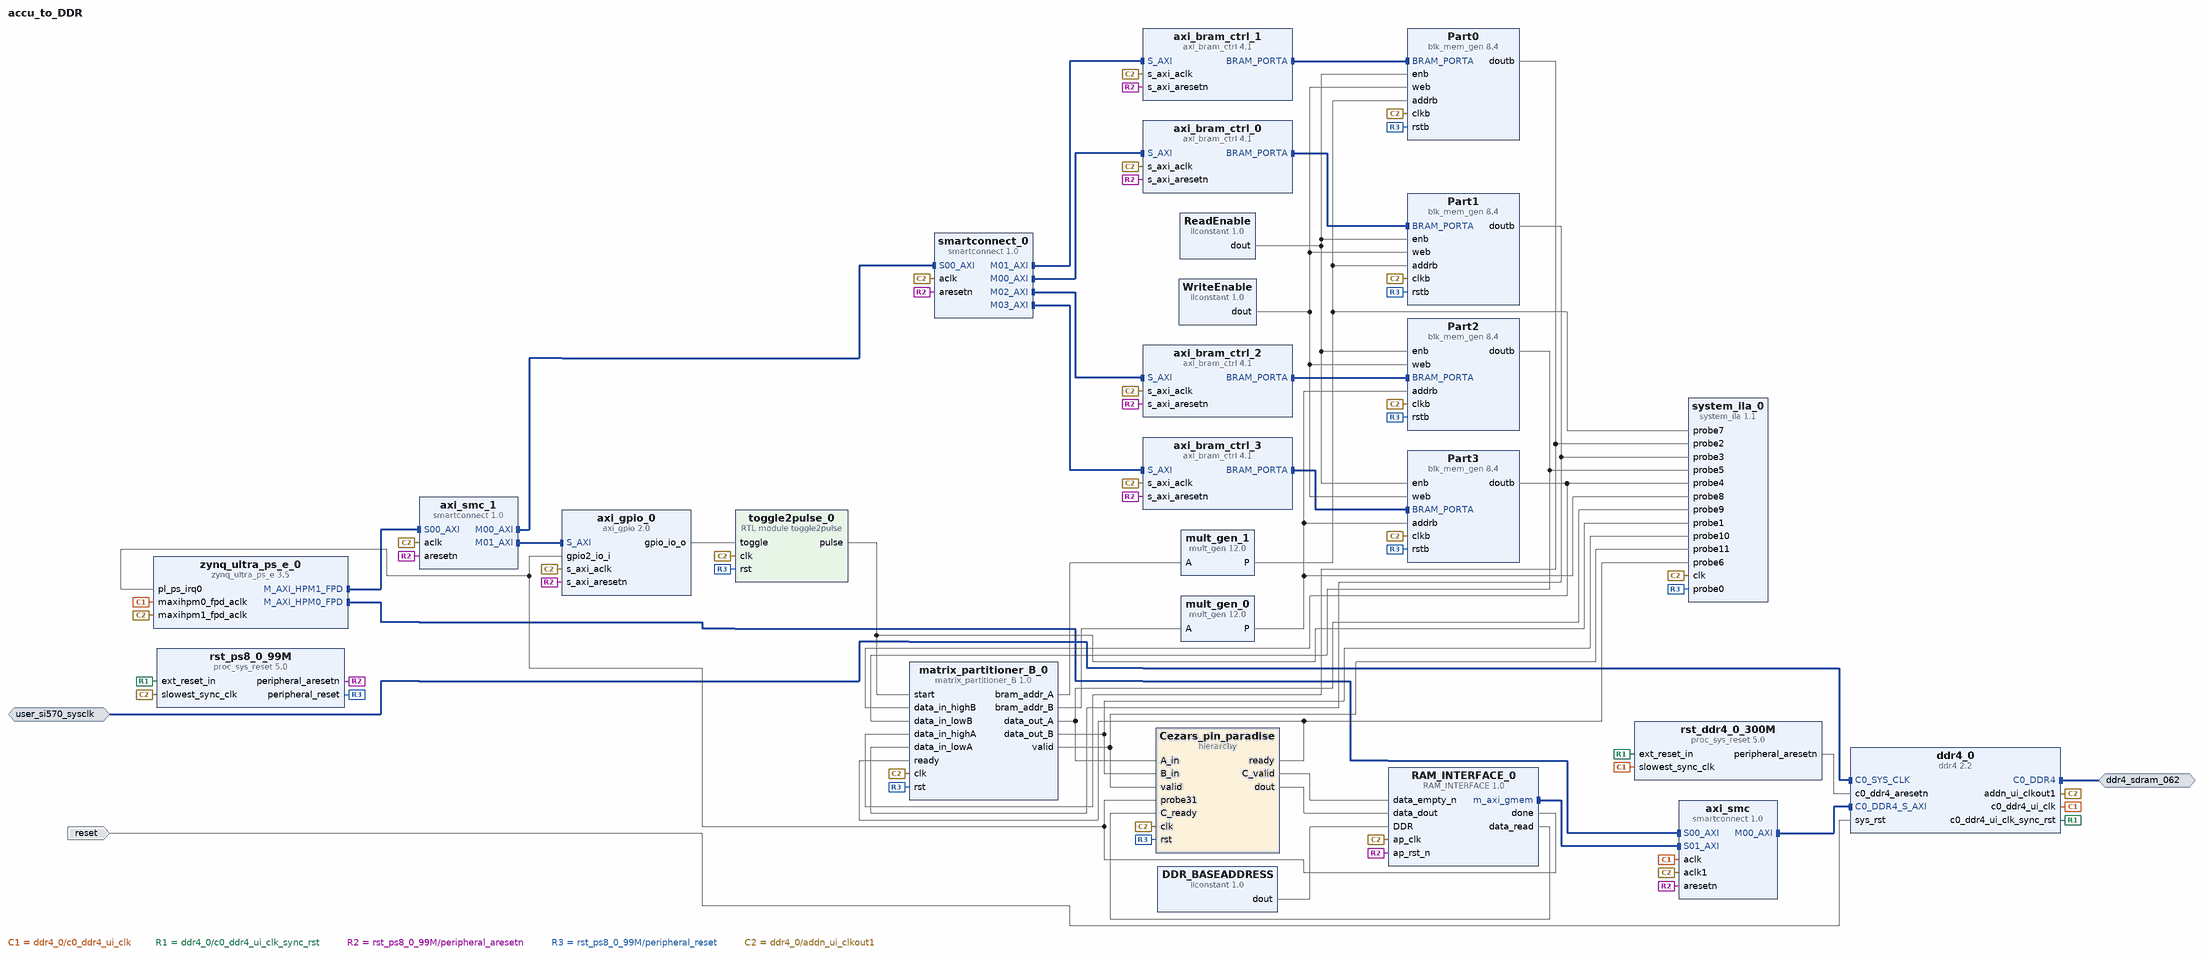
[diagram p0: block diagram of the top level]
# Vivado block design accu_to_DDR, xczu9eg-ffvb1156-2-e, Vivado 2025.1.1
create_bd_design accu_to_DDR

create_bd_intf_port -mode Master -vlnv xilinx.com:interface:ddr4_rtl:1.0 ddr4_sdram_062
create_bd_intf_port -mode Slave -vlnv xilinx.com:interface:diff_clock_rtl:1.0 user_si570_sysclk
set_property -dict {CONFIG.FREQ_HZ 300000000} [get_bd_intf_ports user_si570_sysclk]
create_bd_port -dir I -type rst reset
set_property -dict {CONFIG.POLARITY ACTIVE_HIGH} [get_bd_ports reset]

create_bd_cell -type hier Cezars_pin_paradise
create_bd_cell -type ip -vlnv xilinx.com:ip:zynq_ultra_ps_e:3.5 zynq_ultra_ps_e_0
set_property -dict [list \
  CONFIG.PSU_BANK_0_IO_STANDARD LVCMOS18 \
  CONFIG.PSU_BANK_1_IO_STANDARD LVCMOS18 \
  CONFIG.PSU_BANK_2_IO_STANDARD LVCMOS18 \
  CONFIG.PSU_BANK_3_IO_STANDARD LVCMOS18 \
  CONFIG.PSU_DYNAMIC_DDR_CONFIG_EN 1 \
  CONFIG.PSU_USB3__DUAL_CLOCK_ENABLE 1 \
  CONFIG.PSU__CAN1__PERIPHERAL__ENABLE 1 \
  CONFIG.PSU__CAN1__PERIPHERAL__IO {MIO 24 .. 25} \
  CONFIG.PSU__CRF_APB__ACPU_CTRL__FREQMHZ 1200 \
  CONFIG.PSU__CRF_APB__ACPU_CTRL__SRCSEL APLL \
  CONFIG.PSU__CRF_APB__APLL_CTRL__SRCSEL PSS_REF_CLK \
  CONFIG.PSU__CRF_APB__DBG_FPD_CTRL__FREQMHZ 250 \
  CONFIG.PSU__CRF_APB__DBG_FPD_CTRL__SRCSEL IOPLL \
  CONFIG.PSU__CRF_APB__DBG_TRACE_CTRL__FREQMHZ 250 \
  CONFIG.PSU__CRF_APB__DBG_TRACE_CTRL__SRCSEL IOPLL \
  CONFIG.PSU__CRF_APB__DBG_TSTMP_CTRL__FREQMHZ 250 \
  CONFIG.PSU__CRF_APB__DBG_TSTMP_CTRL__SRCSEL IOPLL \
  CONFIG.PSU__CRF_APB__DDR_CTRL__FREQMHZ 1067 \
  CONFIG.PSU__CRF_APB__DDR_CTRL__SRCSEL DPLL \
  CONFIG.PSU__CRF_APB__DPDMA_REF_CTRL__FREQMHZ 600 \
  CONFIG.PSU__CRF_APB__DPDMA_REF_CTRL__SRCSEL APLL \
  CONFIG.PSU__CRF_APB__DPLL_CTRL__SRCSEL PSS_REF_CLK \
  CONFIG.PSU__CRF_APB__DP_AUDIO_REF_CTRL__SRCSEL RPLL \
  CONFIG.PSU__CRF_APB__DP_STC_REF_CTRL__SRCSEL RPLL \
  CONFIG.PSU__CRF_APB__DP_VIDEO_REF_CTRL__SRCSEL VPLL \
  CONFIG.PSU__CRF_APB__GDMA_REF_CTRL__FREQMHZ 600 \
  CONFIG.PSU__CRF_APB__GDMA_REF_CTRL__SRCSEL APLL \
  CONFIG.PSU__CRF_APB__GPU_REF_CTRL__FREQMHZ 500 \
  CONFIG.PSU__CRF_APB__GPU_REF_CTRL__SRCSEL IOPLL \
  CONFIG.PSU__CRF_APB__TOPSW_LSBUS_CTRL__FREQMHZ 100 \
  CONFIG.PSU__CRF_APB__TOPSW_LSBUS_CTRL__SRCSEL IOPLL \
  CONFIG.PSU__CRF_APB__TOPSW_MAIN_CTRL__FREQMHZ 533.33 \
  CONFIG.PSU__CRF_APB__TOPSW_MAIN_CTRL__SRCSEL DPLL \
  CONFIG.PSU__CRF_APB__VPLL_CTRL__SRCSEL PSS_REF_CLK \
  CONFIG.PSU__CRL_APB__ADMA_REF_CTRL__FREQMHZ 500 \
  CONFIG.PSU__CRL_APB__ADMA_REF_CTRL__SRCSEL IOPLL \
  CONFIG.PSU__CRL_APB__CAN1_REF_CTRL__FREQMHZ 100 \
  CONFIG.PSU__CRL_APB__CAN1_REF_CTRL__SRCSEL IOPLL \
  CONFIG.PSU__CRL_APB__CPU_R5_CTRL__FREQMHZ 500 \
  CONFIG.PSU__CRL_APB__CPU_R5_CTRL__SRCSEL IOPLL \
  CONFIG.PSU__CRL_APB__DBG_LPD_CTRL__FREQMHZ 250 \
  CONFIG.PSU__CRL_APB__DBG_LPD_CTRL__SRCSEL IOPLL \
  CONFIG.PSU__CRL_APB__GEM3_REF_CTRL__FREQMHZ 125 \
  CONFIG.PSU__CRL_APB__GEM3_REF_CTRL__SRCSEL IOPLL \
  CONFIG.PSU__CRL_APB__I2C0_REF_CTRL__FREQMHZ 100 \
  CONFIG.PSU__CRL_APB__I2C0_REF_CTRL__SRCSEL IOPLL \
  CONFIG.PSU__CRL_APB__I2C1_REF_CTRL__FREQMHZ 100 \
  CONFIG.PSU__CRL_APB__I2C1_REF_CTRL__SRCSEL IOPLL \
  CONFIG.PSU__CRL_APB__IOPLL_CTRL__SRCSEL PSS_REF_CLK \
  CONFIG.PSU__CRL_APB__IOU_SWITCH_CTRL__FREQMHZ 250 \
  CONFIG.PSU__CRL_APB__IOU_SWITCH_CTRL__SRCSEL IOPLL \
  CONFIG.PSU__CRL_APB__LPD_LSBUS_CTRL__FREQMHZ 100 \
  CONFIG.PSU__CRL_APB__LPD_LSBUS_CTRL__SRCSEL IOPLL \
  CONFIG.PSU__CRL_APB__LPD_SWITCH_CTRL__FREQMHZ 500 \
  CONFIG.PSU__CRL_APB__LPD_SWITCH_CTRL__SRCSEL IOPLL \
  CONFIG.PSU__CRL_APB__PCAP_CTRL__FREQMHZ 200 \
  CONFIG.PSU__CRL_APB__PCAP_CTRL__SRCSEL IOPLL \
  CONFIG.PSU__CRL_APB__QSPI_REF_CTRL__FREQMHZ 125 \
  CONFIG.PSU__CRL_APB__QSPI_REF_CTRL__SRCSEL IOPLL \
  CONFIG.PSU__CRL_APB__RPLL_CTRL__SRCSEL PSS_REF_CLK \
  CONFIG.PSU__CRL_APB__SDIO1_REF_CTRL__FREQMHZ 200 \
  CONFIG.PSU__CRL_APB__SDIO1_REF_CTRL__SRCSEL IOPLL \
  CONFIG.PSU__CRL_APB__TIMESTAMP_REF_CTRL__FREQMHZ 100 \
  CONFIG.PSU__CRL_APB__TIMESTAMP_REF_CTRL__SRCSEL IOPLL \
  CONFIG.PSU__CRL_APB__UART0_REF_CTRL__FREQMHZ 100 \
  CONFIG.PSU__CRL_APB__UART0_REF_CTRL__SRCSEL IOPLL \
  CONFIG.PSU__CRL_APB__UART1_REF_CTRL__FREQMHZ 100 \
  CONFIG.PSU__CRL_APB__UART1_REF_CTRL__SRCSEL IOPLL \
  CONFIG.PSU__CRL_APB__USB0_BUS_REF_CTRL__FREQMHZ 250 \
  CONFIG.PSU__CRL_APB__USB0_BUS_REF_CTRL__SRCSEL IOPLL \
  CONFIG.PSU__CRL_APB__USB3_DUAL_REF_CTRL__FREQMHZ 20 \
  CONFIG.PSU__CRL_APB__USB3_DUAL_REF_CTRL__SRCSEL IOPLL \
  CONFIG.PSU__CRL_APB__USB3__ENABLE 1 \
  CONFIG.PSU__CSUPMU__PERIPHERAL__VALID 1 \
  CONFIG.PSU__DDRC__BUS_WIDTH {64 Bit} \
  CONFIG.PSU__DDRC__COMPONENTS UDIMM \
  CONFIG.PSU__DDRC__DEVICE_CAPACITY {4096 MBits} \
  CONFIG.PSU__DDRC__DRAM_WIDTH {8 Bits} \
  CONFIG.PSU__DDRC__ECC Disabled \
  CONFIG.PSU__DDRC__MEMORY_TYPE {DDR 4} \
  CONFIG.PSU__DDRC__SPEED_BIN DDR4_2133P \
  CONFIG.PSU__DDR_HIGH_ADDRESS_GUI_ENABLE 1 \
  CONFIG.PSU__DDR__INTERFACE__FREQMHZ 533.500 \
  CONFIG.PSU__DISPLAYPORT__LANE0__ENABLE 1 \
  CONFIG.PSU__DISPLAYPORT__LANE0__IO {GT Lane1} \
  CONFIG.PSU__DISPLAYPORT__LANE1__ENABLE 0 \
  CONFIG.PSU__DISPLAYPORT__PERIPHERAL__ENABLE 1 \
  CONFIG.PSU__DLL__ISUSED 1 \
  CONFIG.PSU__DPAUX__PERIPHERAL__ENABLE 1 \
  CONFIG.PSU__DPAUX__PERIPHERAL__IO {MIO 27 .. 30} \
  CONFIG.PSU__DP__LANE_SEL {Single Lower} \
  CONFIG.PSU__DP__REF_CLK_FREQ 27 \
  CONFIG.PSU__DP__REF_CLK_SEL {Ref Clk3} \
  CONFIG.PSU__ENET3__FIFO__ENABLE 0 \
  CONFIG.PSU__ENET3__GRP_MDIO__ENABLE 1 \
  CONFIG.PSU__ENET3__GRP_MDIO__IO {MIO 76 .. 77} \
  CONFIG.PSU__ENET3__PERIPHERAL__ENABLE 1 \
  CONFIG.PSU__ENET3__PERIPHERAL__IO {MIO 64 .. 75} \
  CONFIG.PSU__ENET3__PTP__ENABLE 0 \
  CONFIG.PSU__ENET3__TSU__ENABLE 0 \
  CONFIG.PSU__FPGA_PL0_ENABLE 0 \
  CONFIG.PSU__GEM3_COHERENCY 0 \
  CONFIG.PSU__GEM3_ROUTE_THROUGH_FPD 0 \
  CONFIG.PSU__GEM__TSU__ENABLE 0 \
  CONFIG.PSU__GPIO0_MIO__IO {MIO 0 .. 25} \
  CONFIG.PSU__GPIO0_MIO__PERIPHERAL__ENABLE 1 \
  CONFIG.PSU__GPIO1_MIO__IO {MIO 26 .. 51} \
  CONFIG.PSU__GPIO1_MIO__PERIPHERAL__ENABLE 1 \
  CONFIG.PSU__GPIO_EMIO__WIDTH {[95:0]} \
  CONFIG.PSU__GT__LINK_SPEED HBR \
  CONFIG.PSU__GT__PRE_EMPH_LVL_4 0 \
  CONFIG.PSU__GT__VLT_SWNG_LVL_4 0 \
  CONFIG.PSU__I2C0__PERIPHERAL__ENABLE 1 \
  CONFIG.PSU__I2C0__PERIPHERAL__IO {MIO 14 .. 15} \
  CONFIG.PSU__I2C1__PERIPHERAL__ENABLE 1 \
  CONFIG.PSU__I2C1__PERIPHERAL__IO {MIO 16 .. 17} \
  CONFIG.PSU__IOU_SLCR__IOU_TTC_APB_CLK__TTC0_SEL APB \
  CONFIG.PSU__IOU_SLCR__IOU_TTC_APB_CLK__TTC1_SEL APB \
  CONFIG.PSU__IOU_SLCR__IOU_TTC_APB_CLK__TTC2_SEL APB \
  CONFIG.PSU__IOU_SLCR__IOU_TTC_APB_CLK__TTC3_SEL APB \
  CONFIG.PSU__MAXIGP0__DATA_WIDTH 128 \
  CONFIG.PSU__OVERRIDE__BASIC_CLOCK 0 \
  CONFIG.PSU__PCIE__BAR0_VAL 0x0 \
  CONFIG.PSU__PCIE__BAR1_VAL 0x0 \
  CONFIG.PSU__PCIE__BAR2_VAL 0x0 \
  CONFIG.PSU__PCIE__BAR3_VAL 0x0 \
  CONFIG.PSU__PCIE__BAR4_VAL 0x0 \
  CONFIG.PSU__PCIE__BAR5_VAL 0x0 \
  CONFIG.PSU__PCIE__CLASS_CODE_BASE 0x06 \
  CONFIG.PSU__PCIE__CLASS_CODE_INTERFACE 0x0 \
  CONFIG.PSU__PCIE__CLASS_CODE_SUB 0x4 \
  CONFIG.PSU__PCIE__CLASS_CODE_VALUE 0x60400 \
  CONFIG.PSU__PCIE__CRS_SW_VISIBILITY 1 \
  CONFIG.PSU__PCIE__DEVICE_ID 0xD021 \
  CONFIG.PSU__PCIE__DEVICE_PORT_TYPE {Root Port} \
  CONFIG.PSU__PCIE__EROM_VAL 0x0 \
  CONFIG.PSU__PCIE__LANE0__ENABLE 1 \
  CONFIG.PSU__PCIE__LANE0__IO {GT Lane0} \
  CONFIG.PSU__PCIE__LINK_SPEED {5.0 Gb/s} \
  CONFIG.PSU__PCIE__MAXIMUM_LINK_WIDTH x1 \
  CONFIG.PSU__PCIE__MAX_PAYLOAD_SIZE {256 bytes} \
  CONFIG.PSU__PCIE__PERIPHERAL__ENABLE 1 \
  CONFIG.PSU__PCIE__PERIPHERAL__ENDPOINT_ENABLE 0 \
  CONFIG.PSU__PCIE__PERIPHERAL__ROOTPORT_ENABLE 1 \
  CONFIG.PSU__PCIE__PERIPHERAL__ROOTPORT_IO {MIO 31} \
  CONFIG.PSU__PCIE__REF_CLK_FREQ 100 \
  CONFIG.PSU__PCIE__REF_CLK_SEL {Ref Clk0} \
  CONFIG.PSU__PCIE__REVISION_ID 0x0 \
  CONFIG.PSU__PCIE__SUBSYSTEM_ID 0x7 \
  CONFIG.PSU__PCIE__SUBSYSTEM_VENDOR_ID 0x10EE \
  CONFIG.PSU__PCIE__VENDOR_ID 0x10EE \
  CONFIG.PSU__PMU_COHERENCY 0 \
  CONFIG.PSU__PMU__AIBACK__ENABLE 0 \
  CONFIG.PSU__PMU__EMIO_GPI__ENABLE 0 \
  CONFIG.PSU__PMU__EMIO_GPO__ENABLE 0 \
  CONFIG.PSU__PMU__GPI0__ENABLE 0 \
  CONFIG.PSU__PMU__GPI1__ENABLE 0 \
  CONFIG.PSU__PMU__GPI2__ENABLE 0 \
  CONFIG.PSU__PMU__GPI3__ENABLE 0 \
  CONFIG.PSU__PMU__GPI4__ENABLE 0 \
  CONFIG.PSU__PMU__GPI5__ENABLE 0 \
  CONFIG.PSU__PMU__GPO0__ENABLE 1 \
  CONFIG.PSU__PMU__GPO0__IO {MIO 32} \
  CONFIG.PSU__PMU__GPO1__ENABLE 1 \
  CONFIG.PSU__PMU__GPO1__IO {MIO 33} \
  CONFIG.PSU__PMU__GPO2__ENABLE 1 \
  CONFIG.PSU__PMU__GPO2__IO {MIO 34} \
  CONFIG.PSU__PMU__GPO2__POLARITY high \
  CONFIG.PSU__PMU__GPO3__ENABLE 1 \
  CONFIG.PSU__PMU__GPO3__IO {MIO 35} \
  CONFIG.PSU__PMU__GPO3__POLARITY low \
  CONFIG.PSU__PMU__GPO4__ENABLE 1 \
  CONFIG.PSU__PMU__GPO4__IO {MIO 36} \
  CONFIG.PSU__PMU__GPO4__POLARITY low \
  CONFIG.PSU__PMU__GPO5__ENABLE 1 \
  CONFIG.PSU__PMU__GPO5__IO {MIO 37} \
  CONFIG.PSU__PMU__GPO5__POLARITY low \
  CONFIG.PSU__PMU__PERIPHERAL__ENABLE 1 \
  CONFIG.PSU__PMU__PLERROR__ENABLE 0 \
  CONFIG.PSU__PRESET_APPLIED 1 \
  CONFIG.PSU__PSS_REF_CLK__FREQMHZ 33.330 \
  CONFIG.PSU__QSPI_COHERENCY 0 \
  CONFIG.PSU__QSPI_ROUTE_THROUGH_FPD 0 \
  CONFIG.PSU__QSPI__GRP_FBCLK__ENABLE 1 \
  CONFIG.PSU__QSPI__GRP_FBCLK__IO {MIO 6} \
  CONFIG.PSU__QSPI__PERIPHERAL__DATA_MODE x4 \
  CONFIG.PSU__QSPI__PERIPHERAL__ENABLE 1 \
  CONFIG.PSU__QSPI__PERIPHERAL__IO {MIO 0 .. 12} \
  CONFIG.PSU__QSPI__PERIPHERAL__MODE {Dual Parallel} \
  CONFIG.PSU__SATA__LANE1__IO {GT Lane3} \
  CONFIG.PSU__SATA__PERIPHERAL__ENABLE 1 \
  CONFIG.PSU__SATA__REF_CLK_FREQ 125 \
  CONFIG.PSU__SATA__REF_CLK_SEL {Ref Clk1} \
  CONFIG.PSU__SD1_COHERENCY 0 \
  CONFIG.PSU__SD1_ROUTE_THROUGH_FPD 0 \
  CONFIG.PSU__SD1__CLK_100_SDR_OTAP_DLY 0x3 \
  CONFIG.PSU__SD1__CLK_200_SDR_OTAP_DLY 0x3 \
  CONFIG.PSU__SD1__CLK_50_DDR_ITAP_DLY 0x3D \
  CONFIG.PSU__SD1__CLK_50_DDR_OTAP_DLY 0x4 \
  CONFIG.PSU__SD1__CLK_50_SDR_ITAP_DLY 0x15 \
  CONFIG.PSU__SD1__CLK_50_SDR_OTAP_DLY 0x5 \
  CONFIG.PSU__SD1__DATA_TRANSFER_MODE 8Bit \
  CONFIG.PSU__SD1__GRP_CD__ENABLE 1 \
  CONFIG.PSU__SD1__GRP_CD__IO {MIO 45} \
  CONFIG.PSU__SD1__GRP_POW__ENABLE 0 \
  CONFIG.PSU__SD1__GRP_WP__ENABLE 1 \
  CONFIG.PSU__SD1__GRP_WP__IO {MIO 44} \
  CONFIG.PSU__SD1__PERIPHERAL__ENABLE 1 \
  CONFIG.PSU__SD1__PERIPHERAL__IO {MIO 39 .. 51} \
  CONFIG.PSU__SD1__SLOT_TYPE {SD 3.0} \
  CONFIG.PSU__SWDT0__CLOCK__ENABLE 0 \
  CONFIG.PSU__SWDT0__PERIPHERAL__ENABLE 1 \
  CONFIG.PSU__SWDT0__RESET__ENABLE 0 \
  CONFIG.PSU__SWDT1__CLOCK__ENABLE 0 \
  CONFIG.PSU__SWDT1__PERIPHERAL__ENABLE 1 \
  CONFIG.PSU__SWDT1__RESET__ENABLE 0 \
  CONFIG.PSU__TSU__BUFG_PORT_PAIR 0 \
  CONFIG.PSU__TTC0__CLOCK__ENABLE 0 \
  CONFIG.PSU__TTC0__PERIPHERAL__ENABLE 1 \
  CONFIG.PSU__TTC0__WAVEOUT__ENABLE 0 \
  CONFIG.PSU__TTC1__CLOCK__ENABLE 0 \
  CONFIG.PSU__TTC1__PERIPHERAL__ENABLE 1 \
  CONFIG.PSU__TTC1__WAVEOUT__ENABLE 0 \
  CONFIG.PSU__TTC2__CLOCK__ENABLE 0 \
  CONFIG.PSU__TTC2__PERIPHERAL__ENABLE 1 \
  CONFIG.PSU__TTC2__WAVEOUT__ENABLE 0 \
  CONFIG.PSU__TTC3__CLOCK__ENABLE 0 \
  CONFIG.PSU__TTC3__PERIPHERAL__ENABLE 1 \
  CONFIG.PSU__TTC3__WAVEOUT__ENABLE 0 \
  CONFIG.PSU__UART0__BAUD_RATE 115200 \
  CONFIG.PSU__UART0__MODEM__ENABLE 0 \
  CONFIG.PSU__UART0__PERIPHERAL__ENABLE 1 \
  CONFIG.PSU__UART0__PERIPHERAL__IO {MIO 18 .. 19} \
  CONFIG.PSU__UART1__BAUD_RATE 115200 \
  CONFIG.PSU__UART1__MODEM__ENABLE 0 \
  CONFIG.PSU__UART1__PERIPHERAL__ENABLE 1 \
  CONFIG.PSU__UART1__PERIPHERAL__IO {MIO 20 .. 21} \
  CONFIG.PSU__USB0_COHERENCY 0 \
  CONFIG.PSU__USB0__PERIPHERAL__ENABLE 1 \
  CONFIG.PSU__USB0__PERIPHERAL__IO {MIO 52 .. 63} \
  CONFIG.PSU__USB0__REF_CLK_FREQ 26 \
  CONFIG.PSU__USB0__REF_CLK_SEL {Ref Clk2} \
  CONFIG.PSU__USB2_0__EMIO__ENABLE 0 \
  CONFIG.PSU__USB3_0__EMIO__ENABLE 0 \
  CONFIG.PSU__USB3_0__PERIPHERAL__ENABLE 1 \
  CONFIG.PSU__USB3_0__PERIPHERAL__IO {GT Lane2} \
  CONFIG.PSU__USB__RESET__MODE {Boot Pin} \
  CONFIG.PSU__USB__RESET__POLARITY {Active Low} \
  CONFIG.PSU__USE__FABRIC__RST 0 \
  CONFIG.PSU__USE__IRQ0 1 \
  CONFIG.PSU__USE__M_AXI_GP0 1 \
  CONFIG.PSU__USE__M_AXI_GP1 1 \
  CONFIG.PSU__USE__M_AXI_GP2 0 \
] [get_bd_cells zynq_ultra_ps_e_0]
# 105 more settings of zynq_ultra_ps_e_0 are not shown: defaults, MIO pin electricals, DDR timing, and values the tool derives
create_bd_cell -type ip -vlnv xilinx.com:ip:proc_sys_reset:5.0 rst_ps8_0_99M
set_property -dict {CONFIG.RESET_BOARD_INTERFACE Custom CONFIG.USE_BOARD_FLOW true} [get_bd_cells rst_ps8_0_99M]
create_bd_cell -type inline_hdl -vlnv xilinx.com:inline_hdl:ilconstant:1.0 DDR_BASEADDRESS
set_property -dict {CONFIG.CONST_VAL 0x400000000 CONFIG.CONST_WIDTH 64} [get_bd_cells DDR_BASEADDRESS]
create_bd_cell -type ip -vlnv xilinx.com:ip:ddr4:2.2 ddr4_0
set_property -dict [list \
  CONFIG.ADDN_UI_CLKOUT1_FREQ_HZ 100 \
  CONFIG.C0_CLOCK_BOARD_INTERFACE user_si570_sysclk \
  CONFIG.C0_DDR4_BOARD_INTERFACE ddr4_sdram_062 \
  CONFIG.RESET_BOARD_INTERFACE reset \
] [get_bd_cells ddr4_0]
create_bd_cell -type ip -vlnv xilinx.com:ip:smartconnect:1.0 axi_smc
set_property -dict {CONFIG.NUM_CLKS 2 CONFIG.NUM_SI 2} [get_bd_cells axi_smc]
create_bd_cell -type ip -vlnv xilinx.com:ip:proc_sys_reset:5.0 rst_ddr4_0_300M
create_bd_cell -type inline_hdl -vlnv xilinx.com:inline_hdl:ilconstant:1.0 ReadEnable
create_bd_cell -type inline_hdl -vlnv xilinx.com:inline_hdl:ilconstant:1.0 WriteEnable
set_property -dict {CONFIG.CONST_VAL 0 CONFIG.CONST_WIDTH 4} [get_bd_cells WriteEnable]
create_bd_cell -type ip -vlnv xilinx.com:ip:smartconnect:1.0 axi_smc_1
set_property -dict {CONFIG.NUM_MI 2 CONFIG.NUM_SI 1} [get_bd_cells axi_smc_1]
create_bd_cell -type module -reference toggle2pulse toggle2pulse_0
set_property -dict {CONFIG.pulse_width 105} [get_bd_cells toggle2pulse_0]
create_bd_cell -type ip -vlnv xilinx.com:ip:system_ila:1.1 system_ila_0
set_property -dict {CONFIG.C_MON_TYPE NATIVE CONFIG.C_NUM_OF_PROBES 12} [get_bd_cells system_ila_0]
create_bd_cell -type ip -vlnv xilinx.com:ip:smartconnect:1.0 smartconnect_0
set_property -dict {CONFIG.NUM_MI 4 CONFIG.NUM_SI 1} [get_bd_cells smartconnect_0]
create_bd_cell -type ip -vlnv xilinx.com:ip:axi_bram_ctrl:4.1 axi_bram_ctrl_0
set_property -dict {CONFIG.DATA_WIDTH 32 CONFIG.SINGLE_PORT_BRAM 1} [get_bd_cells axi_bram_ctrl_0]
create_bd_cell -type ip -vlnv xilinx.com:ip:axi_bram_ctrl:4.1 axi_bram_ctrl_1
set_property -dict {CONFIG.DATA_WIDTH 32 CONFIG.SINGLE_PORT_BRAM 1} [get_bd_cells axi_bram_ctrl_1]
create_bd_cell -type ip -vlnv xilinx.com:ip:blk_mem_gen:8.4 Part1
set_property -dict {CONFIG.Memory_Type True_Dual_Port_RAM} [get_bd_cells Part1]
create_bd_cell -type ip -vlnv xilinx.com:ip:blk_mem_gen:8.4 Part0
set_property -dict {CONFIG.Memory_Type True_Dual_Port_RAM} [get_bd_cells Part0]
create_bd_cell -type ip -vlnv xilinx.com:ip:axi_bram_ctrl:4.1 axi_bram_ctrl_2
set_property -dict {CONFIG.DATA_WIDTH 32 CONFIG.SINGLE_PORT_BRAM 1} [get_bd_cells axi_bram_ctrl_2]
create_bd_cell -type ip -vlnv xilinx.com:ip:axi_bram_ctrl:4.1 axi_bram_ctrl_3
set_property -dict {CONFIG.DATA_WIDTH 32 CONFIG.SINGLE_PORT_BRAM 1} [get_bd_cells axi_bram_ctrl_3]
create_bd_cell -type ip -vlnv xilinx.com:ip:blk_mem_gen:8.4 Part2
set_property -dict {CONFIG.Memory_Type True_Dual_Port_RAM} [get_bd_cells Part2]
create_bd_cell -type ip -vlnv xilinx.com:ip:blk_mem_gen:8.4 Part3
set_property -dict {CONFIG.Memory_Type True_Dual_Port_RAM} [get_bd_cells Part3]
create_bd_cell -type ip -vlnv xilinx.com:ip:axi_gpio:2.0 axi_gpio_0
set_property -dict [list \
  CONFIG.C_ALL_INPUTS_2 1 \
  CONFIG.C_ALL_OUTPUTS 1 \
  CONFIG.C_GPIO2_WIDTH 1 \
  CONFIG.C_GPIO_WIDTH 1 \
  CONFIG.C_IS_DUAL 1 \
] [get_bd_cells axi_gpio_0]
create_bd_cell -type ip -vlnv xilinx.com:ip:mult_gen:12.0 mult_gen_0
set_property -dict [list \
  CONFIG.ConstValue 4 \
  CONFIG.MultType Constant_Coefficient_Multiplier \
  CONFIG.PortAType Unsigned \
] [get_bd_cells mult_gen_0]
create_bd_cell -type ip -vlnv xilinx.com:ip:mult_gen:12.0 mult_gen_1
set_property -dict [list \
  CONFIG.ConstValue 4 \
  CONFIG.MultType Constant_Coefficient_Multiplier \
  CONFIG.PortAType Unsigned \
] [get_bd_cells mult_gen_1]
create_bd_cell -type ip -vlnv xilinx.com:user:matrix_partitioner_B:1.0 matrix_partitioner_B_0
create_bd_cell -type ip -vlnv xilinx.com:hls:RAM_INTERFACE:1.0 RAM_INTERFACE_0

# ---- hierarchy /Cezars_pin_paradise ----
current_bd_instance /Cezars_pin_paradise
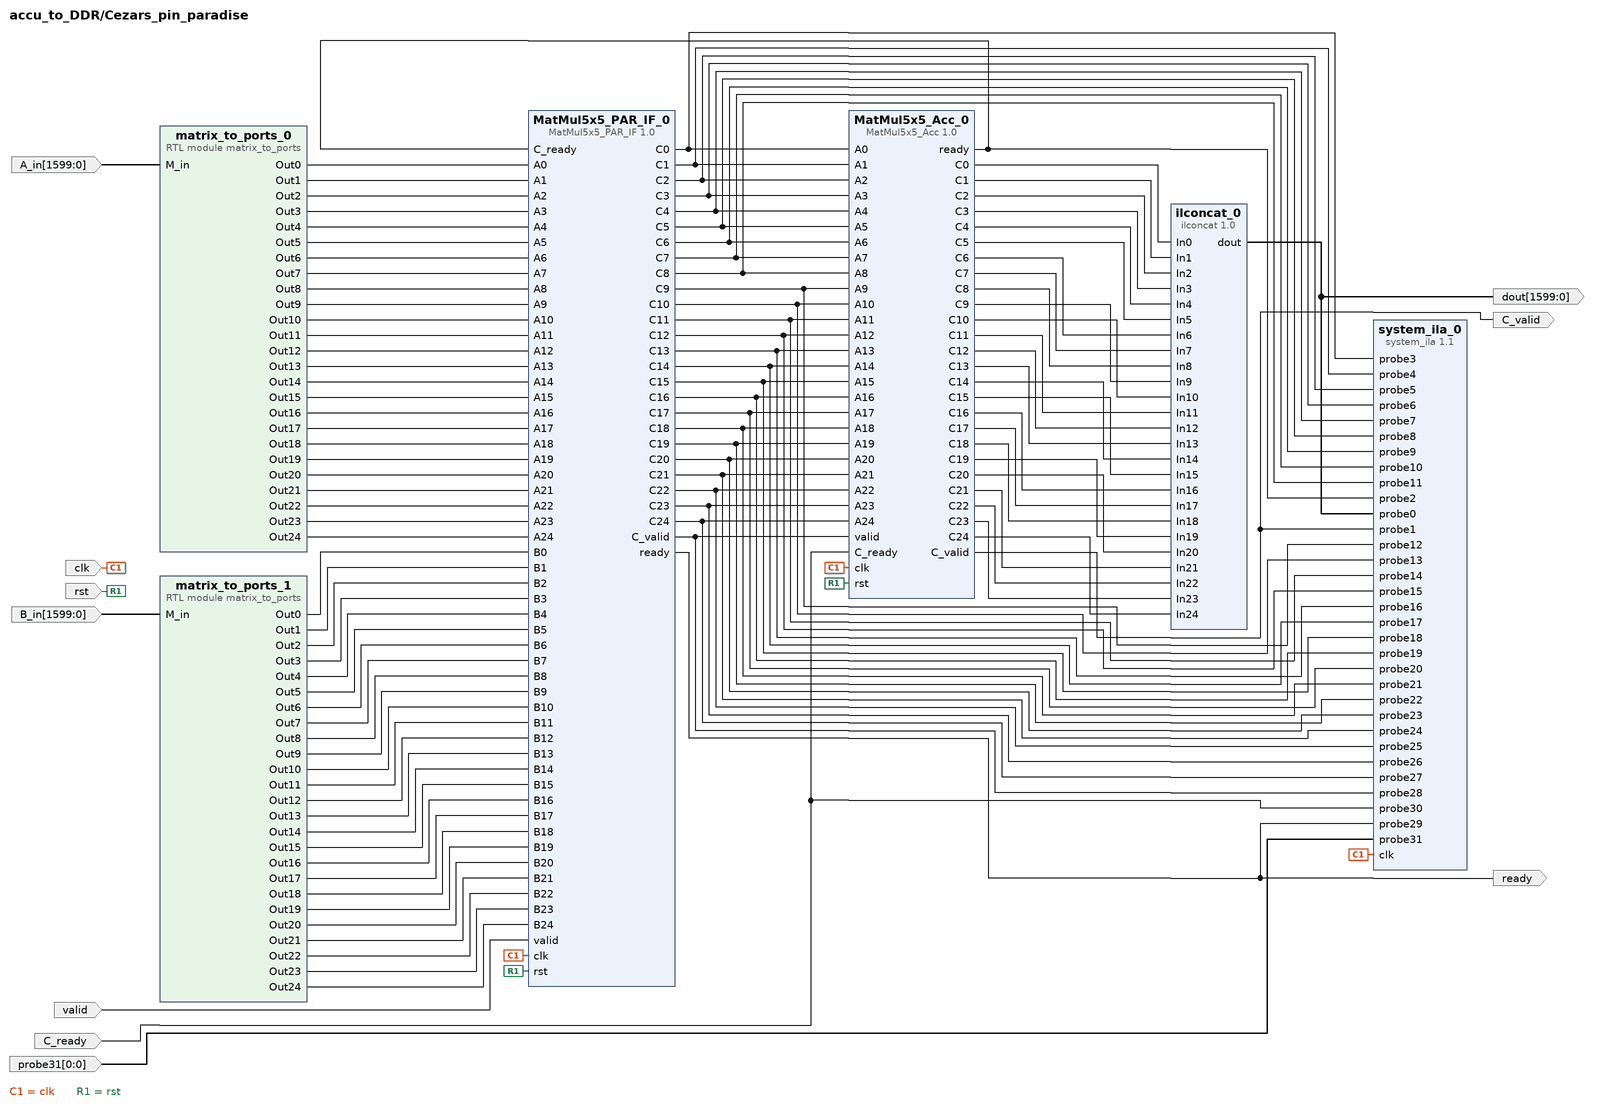
[diagram p1: block diagram inside /Cezars_pin_paradise]
create_bd_pin -dir O C_valid
create_bd_pin -dir I C_ready
create_bd_pin -dir O -from 1599 -to 0 dout
create_bd_pin -dir I -from 1599 -to 0 A_in
create_bd_pin -dir I -from 1599 -to 0 B_in
create_bd_pin -dir I -type clk clk
create_bd_pin -dir I -type rst rst
create_bd_pin -dir I valid
create_bd_pin -dir O ready
create_bd_pin -dir I -from 0 -to 0 probe31

create_bd_cell -type ip -vlnv xilinx.com:user:MatMul5x5_Acc:1.0 MatMul5x5_Acc_0
set_property -dict {CONFIG.NUM_ACCUMULATIONS 10} [get_bd_cells MatMul5x5_Acc_0]
create_bd_cell -type ip -vlnv xilinx.com:user:MatMul5x5_PAR_IF:1.0 MatMul5x5_PAR_IF_0
create_bd_cell -type inline_hdl -vlnv xilinx.com:inline_hdl:ilconcat:1.0 ilconcat_0
set_property -dict {CONFIG.NUM_PORTS 25} [get_bd_cells ilconcat_0]
create_bd_cell -type module -reference matrix_to_ports matrix_to_ports_0
create_bd_cell -type module -reference matrix_to_ports matrix_to_ports_1
create_bd_cell -type ip -vlnv xilinx.com:ip:system_ila:1.1 system_ila_0
set_property -dict [list \
  CONFIG.C_MON_TYPE NATIVE \
  CONFIG.C_NUM_OF_PROBES 32 \
  CONFIG.C_PROBE0_TYPE 0 \
  CONFIG.C_PROBE10_TYPE 0 \
  CONFIG.C_PROBE11_TYPE 0 \
  CONFIG.C_PROBE12_TYPE 0 \
  CONFIG.C_PROBE13_TYPE 0 \
  CONFIG.C_PROBE14_TYPE 0 \
  CONFIG.C_PROBE15_TYPE 0 \
  CONFIG.C_PROBE16_TYPE 0 \
  CONFIG.C_PROBE17_TYPE 0 \
  CONFIG.C_PROBE18_TYPE 0 \
  CONFIG.C_PROBE19_TYPE 0 \
  CONFIG.C_PROBE1_TYPE 0 \
  CONFIG.C_PROBE20_TYPE 0 \
  CONFIG.C_PROBE21_TYPE 0 \
  CONFIG.C_PROBE22_TYPE 0 \
  CONFIG.C_PROBE23_TYPE 0 \
  CONFIG.C_PROBE24_TYPE 0 \
  CONFIG.C_PROBE25_TYPE 0 \
  CONFIG.C_PROBE26_TYPE 0 \
  CONFIG.C_PROBE27_TYPE 0 \
  CONFIG.C_PROBE28_TYPE 0 \
  CONFIG.C_PROBE29_TYPE 0 \
  CONFIG.C_PROBE2_TYPE 0 \
  CONFIG.C_PROBE30_TYPE 0 \
  CONFIG.C_PROBE31_TYPE 0 \
  CONFIG.C_PROBE3_TYPE 0 \
  CONFIG.C_PROBE4_TYPE 0 \
  CONFIG.C_PROBE5_TYPE 0 \
  CONFIG.C_PROBE6_TYPE 0 \
  CONFIG.C_PROBE7_TYPE 0 \
  CONFIG.C_PROBE8_TYPE 0 \
  CONFIG.C_PROBE9_TYPE 0 \
] [get_bd_cells system_ila_0]

# ---- connections ----

current_bd_instance /Cezars_pin_paradise
connect_bd_net -net A_in_1 [get_bd_pins A_in] [get_bd_pins matrix_to_ports_0/M_in]
connect_bd_net -net M_in_1 [get_bd_pins B_in] [get_bd_pins matrix_to_ports_1/M_in]
connect_bd_net [get_bd_pins MatMul5x5_Acc_0/C0] [get_bd_pins ilconcat_0/In0]
connect_bd_net [get_bd_pins MatMul5x5_Acc_0/C1] [get_bd_pins ilconcat_0/In1]
connect_bd_net [get_bd_pins MatMul5x5_Acc_0/C2] [get_bd_pins ilconcat_0/In2]
connect_bd_net [get_bd_pins MatMul5x5_Acc_0/C3] [get_bd_pins ilconcat_0/In3]
connect_bd_net [get_bd_pins MatMul5x5_Acc_0/C4] [get_bd_pins ilconcat_0/In4]
connect_bd_net [get_bd_pins MatMul5x5_Acc_0/C5] [get_bd_pins ilconcat_0/In5]
connect_bd_net [get_bd_pins MatMul5x5_Acc_0/C6] [get_bd_pins ilconcat_0/In6]
connect_bd_net [get_bd_pins MatMul5x5_Acc_0/C7] [get_bd_pins ilconcat_0/In7]
connect_bd_net [get_bd_pins MatMul5x5_Acc_0/C8] [get_bd_pins ilconcat_0/In8]
connect_bd_net [get_bd_pins MatMul5x5_Acc_0/C9] [get_bd_pins ilconcat_0/In9]
connect_bd_net [get_bd_pins MatMul5x5_Acc_0/C10] [get_bd_pins ilconcat_0/In10]
connect_bd_net [get_bd_pins MatMul5x5_Acc_0/C11] [get_bd_pins ilconcat_0/In11]
connect_bd_net [get_bd_pins MatMul5x5_Acc_0/C12] [get_bd_pins ilconcat_0/In12]
connect_bd_net [get_bd_pins MatMul5x5_Acc_0/C13] [get_bd_pins ilconcat_0/In13]
connect_bd_net [get_bd_pins MatMul5x5_Acc_0/C14] [get_bd_pins ilconcat_0/In14]
connect_bd_net [get_bd_pins MatMul5x5_Acc_0/C15] [get_bd_pins ilconcat_0/In15]
connect_bd_net [get_bd_pins MatMul5x5_Acc_0/C16] [get_bd_pins ilconcat_0/In16]
connect_bd_net [get_bd_pins MatMul5x5_Acc_0/C17] [get_bd_pins ilconcat_0/In17]
connect_bd_net [get_bd_pins MatMul5x5_Acc_0/C18] [get_bd_pins ilconcat_0/In18]
connect_bd_net [get_bd_pins MatMul5x5_Acc_0/C19] [get_bd_pins ilconcat_0/In19]
connect_bd_net [get_bd_pins MatMul5x5_Acc_0/C20] [get_bd_pins ilconcat_0/In20]
connect_bd_net [get_bd_pins MatMul5x5_Acc_0/C21] [get_bd_pins ilconcat_0/In21]
connect_bd_net [get_bd_pins MatMul5x5_Acc_0/C22] [get_bd_pins ilconcat_0/In22]
connect_bd_net [get_bd_pins MatMul5x5_Acc_0/C23] [get_bd_pins ilconcat_0/In23]
connect_bd_net [get_bd_pins MatMul5x5_Acc_0/C24] [get_bd_pins ilconcat_0/In24]
connect_bd_net -net MatMul5x5_Acc_0_C_valid [get_bd_pins MatMul5x5_Acc_0/C_valid] [get_bd_pins C_valid] [get_bd_pins system_ila_0/probe1]
connect_bd_net -net MatMul5x5_Acc_0_ready [get_bd_pins MatMul5x5_Acc_0/ready] \
  [get_bd_pins MatMul5x5_PAR_IF_0/C_ready] [get_bd_pins system_ila_0/probe2]
connect_bd_net -net MatMul5x5_PAR_IF_0_C0 [get_bd_pins MatMul5x5_PAR_IF_0/C0] [get_bd_pins MatMul5x5_Acc_0/A0] [get_bd_pins system_ila_0/probe3]
connect_bd_net -net MatMul5x5_PAR_IF_0_C1 [get_bd_pins MatMul5x5_PAR_IF_0/C1] [get_bd_pins MatMul5x5_Acc_0/A1] [get_bd_pins system_ila_0/probe4]
connect_bd_net -net MatMul5x5_PAR_IF_0_C2 [get_bd_pins MatMul5x5_PAR_IF_0/C2] [get_bd_pins MatMul5x5_Acc_0/A2] [get_bd_pins system_ila_0/probe5]
connect_bd_net -net MatMul5x5_PAR_IF_0_C3 [get_bd_pins MatMul5x5_PAR_IF_0/C3] [get_bd_pins MatMul5x5_Acc_0/A3] [get_bd_pins system_ila_0/probe6]
connect_bd_net -net MatMul5x5_PAR_IF_0_C4 [get_bd_pins MatMul5x5_PAR_IF_0/C4] [get_bd_pins MatMul5x5_Acc_0/A4] [get_bd_pins system_ila_0/probe7]
connect_bd_net -net MatMul5x5_PAR_IF_0_C5 [get_bd_pins MatMul5x5_PAR_IF_0/C5] [get_bd_pins MatMul5x5_Acc_0/A5] [get_bd_pins system_ila_0/probe8]
connect_bd_net -net MatMul5x5_PAR_IF_0_C6 [get_bd_pins MatMul5x5_PAR_IF_0/C6] [get_bd_pins MatMul5x5_Acc_0/A6] [get_bd_pins system_ila_0/probe9]
connect_bd_net -net MatMul5x5_PAR_IF_0_C7 [get_bd_pins MatMul5x5_PAR_IF_0/C7] [get_bd_pins MatMul5x5_Acc_0/A7] [get_bd_pins system_ila_0/probe10]
connect_bd_net -net MatMul5x5_PAR_IF_0_C8 [get_bd_pins MatMul5x5_PAR_IF_0/C8] [get_bd_pins MatMul5x5_Acc_0/A8] [get_bd_pins system_ila_0/probe11]
connect_bd_net -net MatMul5x5_PAR_IF_0_C9 [get_bd_pins MatMul5x5_PAR_IF_0/C9] [get_bd_pins MatMul5x5_Acc_0/A9] [get_bd_pins system_ila_0/probe12]
connect_bd_net -net MatMul5x5_PAR_IF_0_C10 [get_bd_pins MatMul5x5_PAR_IF_0/C10] [get_bd_pins MatMul5x5_Acc_0/A10] [get_bd_pins system_ila_0/probe13]
connect_bd_net -net MatMul5x5_PAR_IF_0_C11 [get_bd_pins MatMul5x5_PAR_IF_0/C11] [get_bd_pins MatMul5x5_Acc_0/A11] [get_bd_pins system_ila_0/probe14]
connect_bd_net -net MatMul5x5_PAR_IF_0_C12 [get_bd_pins MatMul5x5_PAR_IF_0/C12] [get_bd_pins MatMul5x5_Acc_0/A12] [get_bd_pins system_ila_0/probe15]
connect_bd_net -net MatMul5x5_PAR_IF_0_C13 [get_bd_pins MatMul5x5_PAR_IF_0/C13] [get_bd_pins MatMul5x5_Acc_0/A13] [get_bd_pins system_ila_0/probe16]
connect_bd_net -net MatMul5x5_PAR_IF_0_C14 [get_bd_pins MatMul5x5_PAR_IF_0/C14] [get_bd_pins MatMul5x5_Acc_0/A14] [get_bd_pins system_ila_0/probe17]
connect_bd_net -net MatMul5x5_PAR_IF_0_C15 [get_bd_pins MatMul5x5_PAR_IF_0/C15] [get_bd_pins MatMul5x5_Acc_0/A15] [get_bd_pins system_ila_0/probe18]
connect_bd_net -net MatMul5x5_PAR_IF_0_C16 [get_bd_pins MatMul5x5_PAR_IF_0/C16] [get_bd_pins MatMul5x5_Acc_0/A16] [get_bd_pins system_ila_0/probe19]
connect_bd_net -net MatMul5x5_PAR_IF_0_C17 [get_bd_pins MatMul5x5_PAR_IF_0/C17] [get_bd_pins MatMul5x5_Acc_0/A17] [get_bd_pins system_ila_0/probe20]
connect_bd_net -net MatMul5x5_PAR_IF_0_C18 [get_bd_pins MatMul5x5_PAR_IF_0/C18] [get_bd_pins MatMul5x5_Acc_0/A18] [get_bd_pins system_ila_0/probe21]
connect_bd_net -net MatMul5x5_PAR_IF_0_C19 [get_bd_pins MatMul5x5_PAR_IF_0/C19] [get_bd_pins MatMul5x5_Acc_0/A19] [get_bd_pins system_ila_0/probe22]
connect_bd_net -net MatMul5x5_PAR_IF_0_C20 [get_bd_pins MatMul5x5_PAR_IF_0/C20] [get_bd_pins MatMul5x5_Acc_0/A20] [get_bd_pins system_ila_0/probe23]
connect_bd_net -net MatMul5x5_PAR_IF_0_C21 [get_bd_pins MatMul5x5_PAR_IF_0/C21] [get_bd_pins MatMul5x5_Acc_0/A21] [get_bd_pins system_ila_0/probe24]
connect_bd_net -net MatMul5x5_PAR_IF_0_C22 [get_bd_pins MatMul5x5_PAR_IF_0/C22] [get_bd_pins MatMul5x5_Acc_0/A22] [get_bd_pins system_ila_0/probe25]
connect_bd_net -net MatMul5x5_PAR_IF_0_C23 [get_bd_pins MatMul5x5_PAR_IF_0/C23] [get_bd_pins MatMul5x5_Acc_0/A23] [get_bd_pins system_ila_0/probe26]
connect_bd_net -net MatMul5x5_PAR_IF_0_C24 [get_bd_pins MatMul5x5_PAR_IF_0/C24] [get_bd_pins MatMul5x5_Acc_0/A24] [get_bd_pins system_ila_0/probe27]
connect_bd_net -net MatMul5x5_PAR_IF_0_C_valid [get_bd_pins MatMul5x5_PAR_IF_0/C_valid] \
  [get_bd_pins MatMul5x5_Acc_0/valid] [get_bd_pins system_ila_0/probe28]
connect_bd_net -net MatMul5x5_PAR_IF_0_ready [get_bd_pins MatMul5x5_PAR_IF_0/ready] [get_bd_pins ready] [get_bd_pins system_ila_0/probe29]
connect_bd_net -net RAM_INTERFACE_0_ready_r [get_bd_pins C_ready] [get_bd_pins MatMul5x5_Acc_0/C_ready] [get_bd_pins system_ila_0/probe30]
connect_bd_net [get_bd_pins clk] [get_bd_pins MatMul5x5_Acc_0/clk] [get_bd_pins MatMul5x5_PAR_IF_0/clk] [get_bd_pins system_ila_0/clk]
connect_bd_net -net ilconcat_0_dout [get_bd_pins ilconcat_0/dout] [get_bd_pins dout] [get_bd_pins system_ila_0/probe0]
connect_bd_net [get_bd_pins matrix_to_ports_0/Out0] [get_bd_pins MatMul5x5_PAR_IF_0/A0]
connect_bd_net [get_bd_pins matrix_to_ports_0/Out1] [get_bd_pins MatMul5x5_PAR_IF_0/A1]
connect_bd_net [get_bd_pins matrix_to_ports_0/Out2] [get_bd_pins MatMul5x5_PAR_IF_0/A2]
connect_bd_net [get_bd_pins matrix_to_ports_0/Out3] [get_bd_pins MatMul5x5_PAR_IF_0/A3]
connect_bd_net [get_bd_pins matrix_to_ports_0/Out4] [get_bd_pins MatMul5x5_PAR_IF_0/A4]
connect_bd_net [get_bd_pins matrix_to_ports_0/Out5] [get_bd_pins MatMul5x5_PAR_IF_0/A5]
connect_bd_net [get_bd_pins matrix_to_ports_0/Out6] [get_bd_pins MatMul5x5_PAR_IF_0/A6]
connect_bd_net [get_bd_pins matrix_to_ports_0/Out7] [get_bd_pins MatMul5x5_PAR_IF_0/A7]
connect_bd_net [get_bd_pins matrix_to_ports_0/Out8] [get_bd_pins MatMul5x5_PAR_IF_0/A8]
connect_bd_net [get_bd_pins matrix_to_ports_0/Out9] [get_bd_pins MatMul5x5_PAR_IF_0/A9]
connect_bd_net [get_bd_pins matrix_to_ports_0/Out10] [get_bd_pins MatMul5x5_PAR_IF_0/A10]
connect_bd_net [get_bd_pins matrix_to_ports_0/Out11] [get_bd_pins MatMul5x5_PAR_IF_0/A11]
connect_bd_net [get_bd_pins matrix_to_ports_0/Out12] [get_bd_pins MatMul5x5_PAR_IF_0/A12]
connect_bd_net [get_bd_pins matrix_to_ports_0/Out13] [get_bd_pins MatMul5x5_PAR_IF_0/A13]
connect_bd_net [get_bd_pins matrix_to_ports_0/Out14] [get_bd_pins MatMul5x5_PAR_IF_0/A14]
connect_bd_net [get_bd_pins matrix_to_ports_0/Out15] [get_bd_pins MatMul5x5_PAR_IF_0/A15]
connect_bd_net [get_bd_pins matrix_to_ports_0/Out16] [get_bd_pins MatMul5x5_PAR_IF_0/A16]
connect_bd_net [get_bd_pins matrix_to_ports_0/Out17] [get_bd_pins MatMul5x5_PAR_IF_0/A17]
connect_bd_net [get_bd_pins matrix_to_ports_0/Out18] [get_bd_pins MatMul5x5_PAR_IF_0/A18]
connect_bd_net [get_bd_pins matrix_to_ports_0/Out19] [get_bd_pins MatMul5x5_PAR_IF_0/A19]
connect_bd_net [get_bd_pins matrix_to_ports_0/Out20] [get_bd_pins MatMul5x5_PAR_IF_0/A20]
connect_bd_net [get_bd_pins matrix_to_ports_0/Out21] [get_bd_pins MatMul5x5_PAR_IF_0/A21]
connect_bd_net [get_bd_pins matrix_to_ports_0/Out22] [get_bd_pins MatMul5x5_PAR_IF_0/A22]
connect_bd_net [get_bd_pins matrix_to_ports_0/Out23] [get_bd_pins MatMul5x5_PAR_IF_0/A23]
connect_bd_net [get_bd_pins matrix_to_ports_0/Out24] [get_bd_pins MatMul5x5_PAR_IF_0/A24]
connect_bd_net [get_bd_pins matrix_to_ports_1/Out0] [get_bd_pins MatMul5x5_PAR_IF_0/B0]
connect_bd_net [get_bd_pins matrix_to_ports_1/Out1] [get_bd_pins MatMul5x5_PAR_IF_0/B1]
connect_bd_net [get_bd_pins matrix_to_ports_1/Out2] [get_bd_pins MatMul5x5_PAR_IF_0/B2]
connect_bd_net [get_bd_pins matrix_to_ports_1/Out3] [get_bd_pins MatMul5x5_PAR_IF_0/B3]
connect_bd_net [get_bd_pins matrix_to_ports_1/Out4] [get_bd_pins MatMul5x5_PAR_IF_0/B4]
connect_bd_net [get_bd_pins matrix_to_ports_1/Out5] [get_bd_pins MatMul5x5_PAR_IF_0/B5]
connect_bd_net [get_bd_pins matrix_to_ports_1/Out6] [get_bd_pins MatMul5x5_PAR_IF_0/B6]
connect_bd_net [get_bd_pins matrix_to_ports_1/Out7] [get_bd_pins MatMul5x5_PAR_IF_0/B7]
connect_bd_net [get_bd_pins matrix_to_ports_1/Out8] [get_bd_pins MatMul5x5_PAR_IF_0/B8]
connect_bd_net [get_bd_pins matrix_to_ports_1/Out9] [get_bd_pins MatMul5x5_PAR_IF_0/B9]
connect_bd_net [get_bd_pins matrix_to_ports_1/Out10] [get_bd_pins MatMul5x5_PAR_IF_0/B10]
connect_bd_net [get_bd_pins matrix_to_ports_1/Out11] [get_bd_pins MatMul5x5_PAR_IF_0/B11]
connect_bd_net [get_bd_pins matrix_to_ports_1/Out12] [get_bd_pins MatMul5x5_PAR_IF_0/B12]
connect_bd_net [get_bd_pins matrix_to_ports_1/Out13] [get_bd_pins MatMul5x5_PAR_IF_0/B13]
connect_bd_net [get_bd_pins matrix_to_ports_1/Out14] [get_bd_pins MatMul5x5_PAR_IF_0/B14]
connect_bd_net [get_bd_pins matrix_to_ports_1/Out15] [get_bd_pins MatMul5x5_PAR_IF_0/B15]
connect_bd_net [get_bd_pins matrix_to_ports_1/Out16] [get_bd_pins MatMul5x5_PAR_IF_0/B16]
connect_bd_net [get_bd_pins matrix_to_ports_1/Out17] [get_bd_pins MatMul5x5_PAR_IF_0/B17]
connect_bd_net [get_bd_pins matrix_to_ports_1/Out18] [get_bd_pins MatMul5x5_PAR_IF_0/B18]
connect_bd_net [get_bd_pins matrix_to_ports_1/Out19] [get_bd_pins MatMul5x5_PAR_IF_0/B19]
connect_bd_net [get_bd_pins matrix_to_ports_1/Out20] [get_bd_pins MatMul5x5_PAR_IF_0/B20]
connect_bd_net [get_bd_pins matrix_to_ports_1/Out21] [get_bd_pins MatMul5x5_PAR_IF_0/B21]
connect_bd_net [get_bd_pins matrix_to_ports_1/Out22] [get_bd_pins MatMul5x5_PAR_IF_0/B22]
connect_bd_net [get_bd_pins matrix_to_ports_1/Out23] [get_bd_pins MatMul5x5_PAR_IF_0/B23]
connect_bd_net [get_bd_pins matrix_to_ports_1/Out24] [get_bd_pins MatMul5x5_PAR_IF_0/B24]
connect_bd_net -net probe31_1 [get_bd_pins probe31] [get_bd_pins system_ila_0/probe31]
connect_bd_net -net rst_1 [get_bd_pins rst] [get_bd_pins MatMul5x5_Acc_0/rst] [get_bd_pins MatMul5x5_PAR_IF_0/rst]
connect_bd_net -net valid_1 [get_bd_pins valid] [get_bd_pins MatMul5x5_PAR_IF_0/valid]
set_property HDL_ATTRIBUTE.DEBUG true [get_bd_nets A_in_1]
set_property HDL_ATTRIBUTE.DEBUG true [get_bd_nets M_in_1]
set_property HDL_ATTRIBUTE.DEBUG true [get_bd_nets MatMul5x5_Acc_0_C_valid]
set_property HDL_ATTRIBUTE.MARK_DEBUG true [get_bd_nets MatMul5x5_Acc_0_C_valid]
set_property HDL_ATTRIBUTE.DEBUG true [get_bd_nets MatMul5x5_Acc_0_ready]
set_property HDL_ATTRIBUTE.MARK_DEBUG true [get_bd_nets MatMul5x5_Acc_0_ready]
set_property HDL_ATTRIBUTE.DEBUG true [get_bd_nets MatMul5x5_PAR_IF_0_C0]
set_property HDL_ATTRIBUTE.MARK_DEBUG true [get_bd_nets MatMul5x5_PAR_IF_0_C0]
set_property HDL_ATTRIBUTE.DEBUG true [get_bd_nets MatMul5x5_PAR_IF_0_C1]
set_property HDL_ATTRIBUTE.MARK_DEBUG true [get_bd_nets MatMul5x5_PAR_IF_0_C1]
set_property HDL_ATTRIBUTE.DEBUG true [get_bd_nets MatMul5x5_PAR_IF_0_C2]
set_property HDL_ATTRIBUTE.MARK_DEBUG true [get_bd_nets MatMul5x5_PAR_IF_0_C2]
set_property HDL_ATTRIBUTE.DEBUG true [get_bd_nets MatMul5x5_PAR_IF_0_C3]
set_property HDL_ATTRIBUTE.MARK_DEBUG true [get_bd_nets MatMul5x5_PAR_IF_0_C3]
set_property HDL_ATTRIBUTE.DEBUG true [get_bd_nets MatMul5x5_PAR_IF_0_C4]
set_property HDL_ATTRIBUTE.MARK_DEBUG true [get_bd_nets MatMul5x5_PAR_IF_0_C4]
set_property HDL_ATTRIBUTE.DEBUG true [get_bd_nets MatMul5x5_PAR_IF_0_C5]
set_property HDL_ATTRIBUTE.MARK_DEBUG true [get_bd_nets MatMul5x5_PAR_IF_0_C5]
set_property HDL_ATTRIBUTE.DEBUG true [get_bd_nets MatMul5x5_PAR_IF_0_C6]
set_property HDL_ATTRIBUTE.MARK_DEBUG true [get_bd_nets MatMul5x5_PAR_IF_0_C6]
set_property HDL_ATTRIBUTE.DEBUG true [get_bd_nets MatMul5x5_PAR_IF_0_C7]
set_property HDL_ATTRIBUTE.MARK_DEBUG true [get_bd_nets MatMul5x5_PAR_IF_0_C7]
set_property HDL_ATTRIBUTE.DEBUG true [get_bd_nets MatMul5x5_PAR_IF_0_C8]
set_property HDL_ATTRIBUTE.MARK_DEBUG true [get_bd_nets MatMul5x5_PAR_IF_0_C8]
set_property HDL_ATTRIBUTE.DEBUG true [get_bd_nets MatMul5x5_PAR_IF_0_C9]
set_property HDL_ATTRIBUTE.MARK_DEBUG true [get_bd_nets MatMul5x5_PAR_IF_0_C9]
set_property HDL_ATTRIBUTE.DEBUG true [get_bd_nets MatMul5x5_PAR_IF_0_C10]
set_property HDL_ATTRIBUTE.MARK_DEBUG true [get_bd_nets MatMul5x5_PAR_IF_0_C10]
set_property HDL_ATTRIBUTE.DEBUG true [get_bd_nets MatMul5x5_PAR_IF_0_C11]
set_property HDL_ATTRIBUTE.MARK_DEBUG true [get_bd_nets MatMul5x5_PAR_IF_0_C11]
set_property HDL_ATTRIBUTE.DEBUG true [get_bd_nets MatMul5x5_PAR_IF_0_C12]
set_property HDL_ATTRIBUTE.MARK_DEBUG true [get_bd_nets MatMul5x5_PAR_IF_0_C12]
set_property HDL_ATTRIBUTE.DEBUG true [get_bd_nets MatMul5x5_PAR_IF_0_C13]
set_property HDL_ATTRIBUTE.MARK_DEBUG true [get_bd_nets MatMul5x5_PAR_IF_0_C13]
set_property HDL_ATTRIBUTE.DEBUG true [get_bd_nets MatMul5x5_PAR_IF_0_C14]
set_property HDL_ATTRIBUTE.MARK_DEBUG true [get_bd_nets MatMul5x5_PAR_IF_0_C14]
set_property HDL_ATTRIBUTE.DEBUG true [get_bd_nets MatMul5x5_PAR_IF_0_C15]
set_property HDL_ATTRIBUTE.MARK_DEBUG true [get_bd_nets MatMul5x5_PAR_IF_0_C15]
set_property HDL_ATTRIBUTE.DEBUG true [get_bd_nets MatMul5x5_PAR_IF_0_C16]
set_property HDL_ATTRIBUTE.MARK_DEBUG true [get_bd_nets MatMul5x5_PAR_IF_0_C16]
set_property HDL_ATTRIBUTE.DEBUG true [get_bd_nets MatMul5x5_PAR_IF_0_C17]
set_property HDL_ATTRIBUTE.MARK_DEBUG true [get_bd_nets MatMul5x5_PAR_IF_0_C17]
set_property HDL_ATTRIBUTE.DEBUG true [get_bd_nets MatMul5x5_PAR_IF_0_C18]
set_property HDL_ATTRIBUTE.MARK_DEBUG true [get_bd_nets MatMul5x5_PAR_IF_0_C18]
set_property HDL_ATTRIBUTE.DEBUG true [get_bd_nets MatMul5x5_PAR_IF_0_C19]
set_property HDL_ATTRIBUTE.MARK_DEBUG true [get_bd_nets MatMul5x5_PAR_IF_0_C19]
set_property HDL_ATTRIBUTE.DEBUG true [get_bd_nets MatMul5x5_PAR_IF_0_C20]
set_property HDL_ATTRIBUTE.MARK_DEBUG true [get_bd_nets MatMul5x5_PAR_IF_0_C20]
set_property HDL_ATTRIBUTE.DEBUG true [get_bd_nets MatMul5x5_PAR_IF_0_C21]
set_property HDL_ATTRIBUTE.MARK_DEBUG true [get_bd_nets MatMul5x5_PAR_IF_0_C21]
set_property HDL_ATTRIBUTE.DEBUG true [get_bd_nets MatMul5x5_PAR_IF_0_C22]
set_property HDL_ATTRIBUTE.MARK_DEBUG true [get_bd_nets MatMul5x5_PAR_IF_0_C22]
set_property HDL_ATTRIBUTE.DEBUG true [get_bd_nets MatMul5x5_PAR_IF_0_C23]
set_property HDL_ATTRIBUTE.MARK_DEBUG true [get_bd_nets MatMul5x5_PAR_IF_0_C23]
set_property HDL_ATTRIBUTE.DEBUG true [get_bd_nets MatMul5x5_PAR_IF_0_C24]
set_property HDL_ATTRIBUTE.MARK_DEBUG true [get_bd_nets MatMul5x5_PAR_IF_0_C24]
set_property HDL_ATTRIBUTE.DEBUG true [get_bd_nets MatMul5x5_PAR_IF_0_C_valid]
set_property HDL_ATTRIBUTE.MARK_DEBUG true [get_bd_nets MatMul5x5_PAR_IF_0_C_valid]
set_property HDL_ATTRIBUTE.DEBUG true [get_bd_nets MatMul5x5_PAR_IF_0_ready]
set_property HDL_ATTRIBUTE.MARK_DEBUG true [get_bd_nets MatMul5x5_PAR_IF_0_ready]
set_property HDL_ATTRIBUTE.DEBUG true [get_bd_nets RAM_INTERFACE_0_ready_r]
set_property HDL_ATTRIBUTE.MARK_DEBUG true [get_bd_nets RAM_INTERFACE_0_ready_r]
set_property HDL_ATTRIBUTE.DEBUG true [get_bd_nets ilconcat_0_dout]
set_property HDL_ATTRIBUTE.MARK_DEBUG true [get_bd_nets ilconcat_0_dout]
set_property HDL_ATTRIBUTE.DEBUG true [get_bd_nets probe31_1]
set_property HDL_ATTRIBUTE.DEBUG true [get_bd_nets rst_1]
set_property HDL_ATTRIBUTE.DEBUG true [get_bd_nets valid_1]

current_bd_instance /
connect_bd_intf_net [get_bd_intf_pins RAM_INTERFACE_0/m_axi_gmem] [get_bd_intf_pins axi_smc/S01_AXI]
connect_bd_intf_net [get_bd_intf_pins Part1/BRAM_PORTA] [get_bd_intf_pins axi_bram_ctrl_0/BRAM_PORTA]
connect_bd_intf_net -intf_net axi_bram_ctrl_0_BRAM_PORTA_1 [get_bd_intf_pins Part2/BRAM_PORTA] [get_bd_intf_pins axi_bram_ctrl_2/BRAM_PORTA]
connect_bd_intf_net [get_bd_intf_pins Part0/BRAM_PORTA] [get_bd_intf_pins axi_bram_ctrl_1/BRAM_PORTA]
connect_bd_intf_net -intf_net axi_bram_ctrl_1_BRAM_PORTA_1 [get_bd_intf_pins Part3/BRAM_PORTA] [get_bd_intf_pins axi_bram_ctrl_3/BRAM_PORTA]
connect_bd_intf_net [get_bd_intf_pins axi_smc_1/M00_AXI] [get_bd_intf_pins smartconnect_0/S00_AXI]
connect_bd_intf_net [get_bd_intf_pins axi_smc_1/M01_AXI] [get_bd_intf_pins axi_gpio_0/S_AXI]
connect_bd_intf_net [get_bd_intf_pins axi_smc/M00_AXI] [get_bd_intf_pins ddr4_0/C0_DDR4_S_AXI]
connect_bd_intf_net [get_bd_intf_ports ddr4_sdram_062] [get_bd_intf_pins ddr4_0/C0_DDR4]
connect_bd_intf_net [get_bd_intf_pins smartconnect_0/M00_AXI] [get_bd_intf_pins axi_bram_ctrl_0/S_AXI]
connect_bd_intf_net [get_bd_intf_pins smartconnect_0/M01_AXI] [get_bd_intf_pins axi_bram_ctrl_1/S_AXI]
connect_bd_intf_net [get_bd_intf_pins smartconnect_0/M02_AXI] [get_bd_intf_pins axi_bram_ctrl_2/S_AXI]
connect_bd_intf_net [get_bd_intf_pins smartconnect_0/M03_AXI] [get_bd_intf_pins axi_bram_ctrl_3/S_AXI]
connect_bd_intf_net [get_bd_intf_ports user_si570_sysclk] [get_bd_intf_pins ddr4_0/C0_SYS_CLK]
connect_bd_intf_net [get_bd_intf_pins zynq_ultra_ps_e_0/M_AXI_HPM0_FPD] [get_bd_intf_pins axi_smc/S00_AXI]
connect_bd_intf_net [get_bd_intf_pins zynq_ultra_ps_e_0/M_AXI_HPM1_FPD] [get_bd_intf_pins axi_smc_1/S00_AXI]
connect_bd_net -net Brams_MatrixB_Part0_dout [get_bd_pins Part3/doutb] \
  [get_bd_pins system_ila_0/probe4] [get_bd_pins matrix_partitioner_B_0/data_in_highB]
connect_bd_net -net Brams_MatrixB_Part1_dout [get_bd_pins Part2/doutb] \
  [get_bd_pins system_ila_0/probe5] [get_bd_pins matrix_partitioner_B_0/data_in_lowB]
connect_bd_net -net Cezars_pin_paradise_ready [get_bd_pins Cezars_pin_paradise/ready] \
  [get_bd_pins system_ila_0/probe6] [get_bd_pins matrix_partitioner_B_0/ready]
connect_bd_net -net MatMul5x5_Acc_0_C_valid [get_bd_pins Cezars_pin_paradise/C_valid] [get_bd_pins RAM_INTERFACE_0/data_empty_n]
connect_bd_net [get_bd_pins Part0/doutb] [get_bd_pins system_ila_0/probe2] [get_bd_pins matrix_partitioner_B_0/data_in_highA]
connect_bd_net [get_bd_pins Part1/doutb] [get_bd_pins system_ila_0/probe3] [get_bd_pins matrix_partitioner_B_0/data_in_lowA]
connect_bd_net -net RAM_INTERFACE_0_ready_r [get_bd_pins RAM_INTERFACE_0/data_read] [get_bd_pins Cezars_pin_paradise/C_ready]
connect_bd_net [get_bd_pins ReadEnable/dout] [get_bd_pins Part1/enb] [get_bd_pins Part0/enb] [get_bd_pins Part2/enb] [get_bd_pins Part3/enb]
connect_bd_net [get_bd_pins WriteEnable/dout] [get_bd_pins Part1/web] [get_bd_pins Part0/web] [get_bd_pins Part2/web] [get_bd_pins Part3/web]
connect_bd_net [get_bd_pins axi_gpio_0/gpio_io_o] [get_bd_pins toggle2pulse_0/toggle]
connect_bd_net [get_bd_pins ddr4_0/c0_ddr4_ui_clk] \
  [get_bd_pins axi_smc/aclk] [get_bd_pins rst_ddr4_0_300M/slowest_sync_clk] [get_bd_pins zynq_ultra_ps_e_0/maxihpm0_fpd_aclk]
connect_bd_net [get_bd_pins ddr4_0/c0_ddr4_ui_clk_sync_rst] [get_bd_pins rst_ddr4_0_300M/ext_reset_in] [get_bd_pins rst_ps8_0_99M/ext_reset_in]
connect_bd_net -net done [get_bd_pins RAM_INTERFACE_0/done] \
  [get_bd_pins Cezars_pin_paradise/probe31] [get_bd_pins axi_gpio_0/gpio2_io_i] [get_bd_pins zynq_ultra_ps_e_0/pl_ps_irq0]
connect_bd_net -net ilconcat_0_dout [get_bd_pins Cezars_pin_paradise/dout] [get_bd_pins RAM_INTERFACE_0/data_dout]
connect_bd_net -net ilconstant_0_dout [get_bd_pins DDR_BASEADDRESS/dout] [get_bd_pins RAM_INTERFACE_0/DDR]
connect_bd_net -net matrix_partitioner_0_bram_addr_A [get_bd_pins mult_gen_1/P] \
  [get_bd_pins Part1/addrb] [get_bd_pins Part0/addrb] [get_bd_pins system_ila_0/probe7]
connect_bd_net -net matrix_partitioner_0_bram_addr_B [get_bd_pins mult_gen_0/P] \
  [get_bd_pins Part3/addrb] [get_bd_pins Part2/addrb] [get_bd_pins system_ila_0/probe8]
connect_bd_net -net matrix_partitioner_0_data_out_A [get_bd_pins matrix_partitioner_B_0/data_out_A] \
  [get_bd_pins Cezars_pin_paradise/A_in] [get_bd_pins system_ila_0/probe9]
connect_bd_net -net matrix_partitioner_0_data_out_B [get_bd_pins matrix_partitioner_B_0/data_out_B] \
  [get_bd_pins Cezars_pin_paradise/B_in] [get_bd_pins system_ila_0/probe10]
connect_bd_net -net matrix_partitioner_0_valid [get_bd_pins matrix_partitioner_B_0/valid] \
  [get_bd_pins Cezars_pin_paradise/valid] [get_bd_pins system_ila_0/probe11]
connect_bd_net [get_bd_pins matrix_partitioner_B_0/bram_addr_A] [get_bd_pins mult_gen_1/A]
connect_bd_net [get_bd_pins matrix_partitioner_B_0/bram_addr_B] [get_bd_pins mult_gen_0/A]
connect_bd_net [get_bd_ports reset] [get_bd_pins ddr4_0/sys_rst]
connect_bd_net [get_bd_pins rst_ddr4_0_300M/peripheral_aresetn] [get_bd_pins ddr4_0/c0_ddr4_aresetn]
connect_bd_net [get_bd_pins rst_ps8_0_99M/peripheral_aresetn] \
  [get_bd_pins axi_smc_1/aresetn] [get_bd_pins smartconnect_0/aresetn] [get_bd_pins axi_bram_ctrl_0/s_axi_aresetn] \
  [get_bd_pins axi_bram_ctrl_1/s_axi_aresetn] [get_bd_pins axi_bram_ctrl_2/s_axi_aresetn] \
  [get_bd_pins axi_bram_ctrl_3/s_axi_aresetn] [get_bd_pins axi_gpio_0/s_axi_aresetn] [get_bd_pins axi_smc/aresetn] \
  [get_bd_pins RAM_INTERFACE_0/ap_rst_n]
connect_bd_net -net rst_ps8_0_99M_peripheral_reset [get_bd_pins rst_ps8_0_99M/peripheral_reset] \
  [get_bd_pins Cezars_pin_paradise/rst] [get_bd_pins toggle2pulse_0/rst] [get_bd_pins Part0/rstb] [get_bd_pins Part1/rstb] \
  [get_bd_pins Part2/rstb] [get_bd_pins Part3/rstb] [get_bd_pins system_ila_0/probe0] \
  [get_bd_pins matrix_partitioner_B_0/rst]
connect_bd_net -net toggle2pulse_0_pulse [get_bd_pins toggle2pulse_0/pulse] \
  [get_bd_pins system_ila_0/probe1] [get_bd_pins matrix_partitioner_B_0/start]
connect_bd_net -net zynq_ultra_ps_e_0_pl_clk0 [get_bd_pins ddr4_0/addn_ui_clkout1] \
  [get_bd_pins Cezars_pin_paradise/clk] [get_bd_pins rst_ps8_0_99M/slowest_sync_clk] [get_bd_pins axi_smc/aclk1] \
  [get_bd_pins zynq_ultra_ps_e_0/maxihpm1_fpd_aclk] [get_bd_pins axi_smc_1/aclk] [get_bd_pins toggle2pulse_0/clk] \
  [get_bd_pins system_ila_0/clk] [get_bd_pins smartconnect_0/aclk] [get_bd_pins axi_bram_ctrl_0/s_axi_aclk] \
  [get_bd_pins axi_bram_ctrl_1/s_axi_aclk] [get_bd_pins axi_bram_ctrl_2/s_axi_aclk] [get_bd_pins axi_bram_ctrl_3/s_axi_aclk] \
  [get_bd_pins Part1/clkb] [get_bd_pins Part0/clkb] [get_bd_pins Part2/clkb] [get_bd_pins Part3/clkb] \
  [get_bd_pins axi_gpio_0/s_axi_aclk] [get_bd_pins RAM_INTERFACE_0/ap_clk] [get_bd_pins matrix_partitioner_B_0/clk]
set_property HDL_ATTRIBUTE.DEBUG true [get_bd_nets Brams_MatrixB_Part0_dout]
set_property HDL_ATTRIBUTE.MARK_DEBUG true [get_bd_nets Brams_MatrixB_Part0_dout]
set_property HDL_ATTRIBUTE.DEBUG true [get_bd_nets Brams_MatrixB_Part1_dout]
set_property HDL_ATTRIBUTE.MARK_DEBUG true [get_bd_nets Brams_MatrixB_Part1_dout]
set_property HDL_ATTRIBUTE.DEBUG true [get_bd_nets Cezars_pin_paradise_ready]
set_property HDL_ATTRIBUTE.MARK_DEBUG true [get_bd_nets Cezars_pin_paradise_ready]
set_property HDL_ATTRIBUTE.DEBUG true [get_bd_nets MatMul5x5_Acc_0_C_valid]
set_property HDL_ATTRIBUTE.DEBUG true [get_bd_nets RAM_INTERFACE_0_ready_r]
set_property HDL_ATTRIBUTE.DEBUG true [get_bd_nets done]
set_property HDL_ATTRIBUTE.MARK_DEBUG true [get_bd_nets done]
set_property HDL_ATTRIBUTE.DEBUG true [get_bd_nets ilconcat_0_dout]
set_property HDL_ATTRIBUTE.DEBUG true [get_bd_nets matrix_partitioner_0_bram_addr_A]
set_property HDL_ATTRIBUTE.MARK_DEBUG true [get_bd_nets matrix_partitioner_0_bram_addr_A]
set_property HDL_ATTRIBUTE.DEBUG true [get_bd_nets matrix_partitioner_0_bram_addr_B]
set_property HDL_ATTRIBUTE.MARK_DEBUG true [get_bd_nets matrix_partitioner_0_bram_addr_B]
set_property HDL_ATTRIBUTE.DEBUG true [get_bd_nets matrix_partitioner_0_data_out_A]
set_property HDL_ATTRIBUTE.MARK_DEBUG true [get_bd_nets matrix_partitioner_0_data_out_A]
set_property HDL_ATTRIBUTE.DEBUG true [get_bd_nets matrix_partitioner_0_data_out_B]
set_property HDL_ATTRIBUTE.MARK_DEBUG true [get_bd_nets matrix_partitioner_0_data_out_B]
set_property HDL_ATTRIBUTE.DEBUG true [get_bd_nets matrix_partitioner_0_valid]
set_property HDL_ATTRIBUTE.MARK_DEBUG true [get_bd_nets matrix_partitioner_0_valid]
set_property HDL_ATTRIBUTE.DEBUG true [get_bd_nets rst_ps8_0_99M_peripheral_reset]
set_property HDL_ATTRIBUTE.MARK_DEBUG true [get_bd_nets rst_ps8_0_99M_peripheral_reset]
set_property HDL_ATTRIBUTE.DEBUG true [get_bd_nets toggle2pulse_0_pulse]
set_property HDL_ATTRIBUTE.MARK_DEBUG true [get_bd_nets toggle2pulse_0_pulse]

# ---- address map ----
assign_bd_address -offset 0x0000000400000000 -range 512M -target_address_space [get_bd_addr_spaces RAM_INTERFACE_0/Data_m_axi_gmem] [get_bd_addr_segs ddr4_0/C0_DDR4_MEMORY_MAP/C0_DDR4_ADDRESS_BLOCK]
assign_bd_address -offset 0x00B0000000 -range 64K -target_address_space [get_bd_addr_spaces zynq_ultra_ps_e_0/Data] [get_bd_addr_segs axi_gpio_0/S_AXI/Reg]
assign_bd_address -offset 0x0400000000 -range 512M -target_address_space [get_bd_addr_spaces zynq_ultra_ps_e_0/Data] [get_bd_addr_segs ddr4_0/C0_DDR4_MEMORY_MAP/C0_DDR4_ADDRESS_BLOCK]
assign_bd_address -offset 0x0500000000 -range 32K -target_address_space [get_bd_addr_spaces zynq_ultra_ps_e_0/Data] [get_bd_addr_segs axi_bram_ctrl_3/S_AXI/Mem0]
assign_bd_address -offset 0x0500008000 -range 32K -target_address_space [get_bd_addr_spaces zynq_ultra_ps_e_0/Data] [get_bd_addr_segs axi_bram_ctrl_2/S_AXI/Mem0]
assign_bd_address -offset 0x0500010000 -range 32K -target_address_space [get_bd_addr_spaces zynq_ultra_ps_e_0/Data] [get_bd_addr_segs axi_bram_ctrl_1/S_AXI/Mem0]
assign_bd_address -offset 0x0500018000 -range 32K -target_address_space [get_bd_addr_spaces zynq_ultra_ps_e_0/Data] [get_bd_addr_segs axi_bram_ctrl_0/S_AXI/Mem0]

validate_bd_design
save_bd_design
